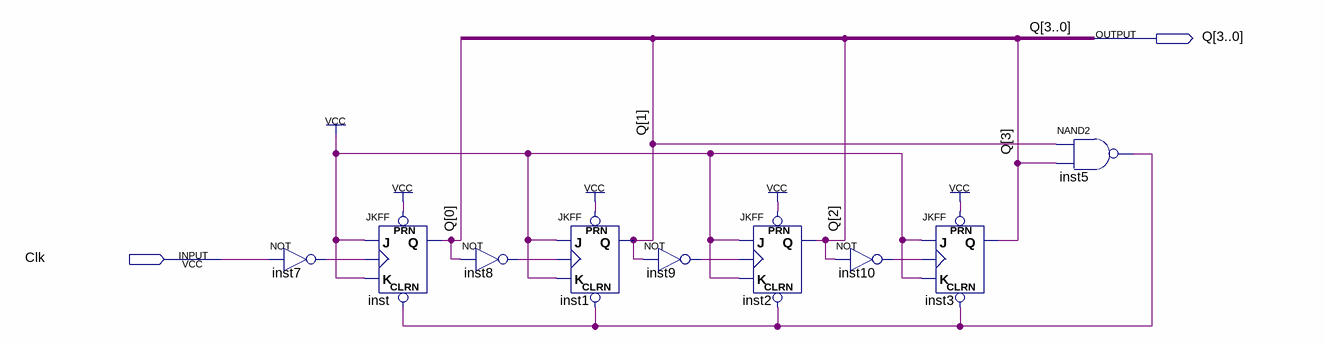
[diagram p0: schematic sheet]
// Quartus schematic RippleUpDown.bdf as structural Verilog: 9 symbols, 2 pins
module RippleUpDown (
  input  Clk,
  output [3:0] Q
);

  wire inst5_out, inst7_out, inst8_out, inst9_out, inst10_out;

  not inst7 (inst7_out, Clk);
  JKFF inst (.PRN(1'b1), .CLRN(inst5_out), .K(1'b1), .J(1'b1), .CLK(inst7_out), .Q(Q[0]));
  not inst8 (inst8_out, Q[0]);
  JKFF inst1 (.PRN(1'b1), .CLRN(inst5_out), .K(1'b1), .J(1'b1), .CLK(inst8_out), .Q(Q[1]));
  not inst9 (inst9_out, Q[1]);
  JKFF inst2 (.PRN(1'b1), .CLRN(inst5_out), .K(1'b1), .J(1'b1), .CLK(inst9_out), .Q(Q[2]));
  not inst10 (inst10_out, Q[2]);
  JKFF inst3 (.PRN(1'b1), .CLRN(inst5_out), .K(1'b1), .J(1'b1), .CLK(inst10_out), .Q(Q[3]));
  nand inst5 (inst5_out, Q[1], Q[3]);
endmodule
